# EasyEDA Pro project elisaday-high-color-value-low-cost-reflow-24a201e4.epro, schematic 电源板-无0402
Board Name: 220V电源板-无0402; Create Date: 2025-08-20; Page Name: 电源板; Project Name: 红龙加热台（星火计划2025）; Schematic Name: 电源板-无0402; Update Date: 2025-09-29; Company: 嘉立创EDA; Page Size: A4; Version: V1.0
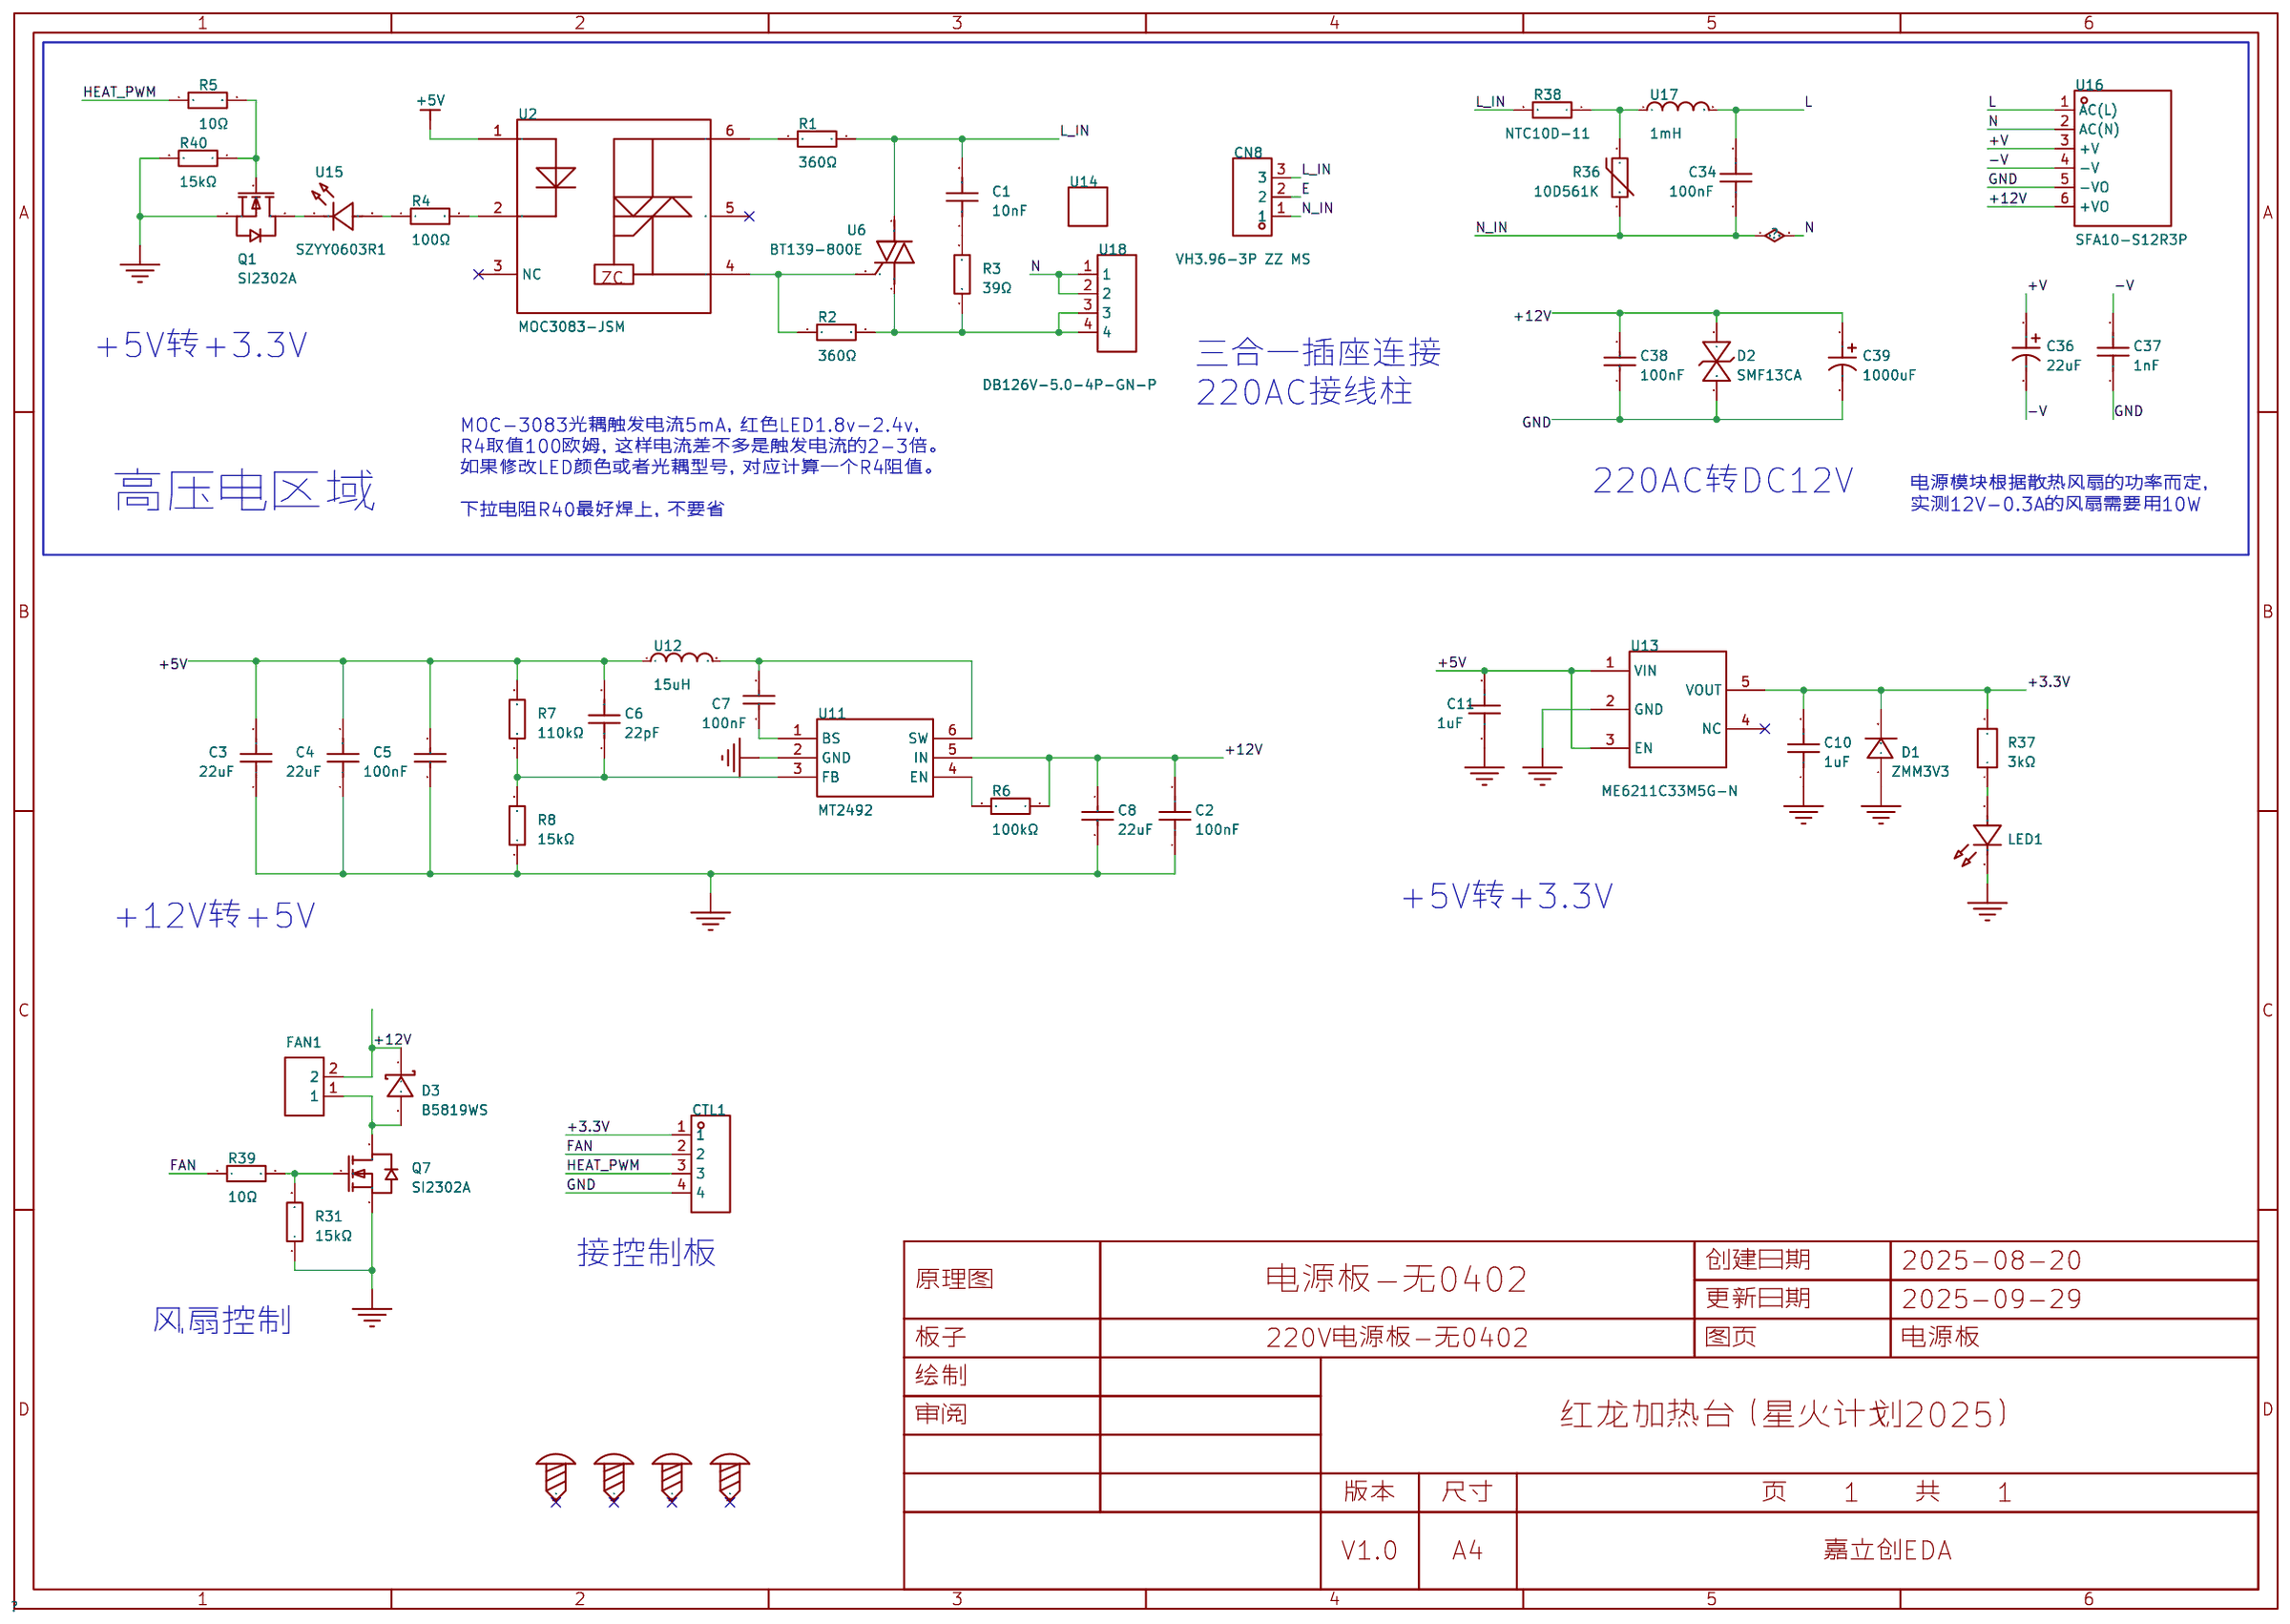
[diagram p2: schematic sheet]

## Parts
C1  10nF  [CAP-TH_L13.0-W6.0-P10.00-D1.2]
C2  100nF  [C0805]
C3  22uF  [C0603]
C4  22uF  [C0603]
C5  100nF  [C0805]
C6  22pF  [C0603]
C7  100nF  [C0805]
C8  22uF  [C1206]
C10  1uF  [C0603]
C11  1uF  [C0603]
C34  100nF  [CAP-TH_L13.0-W6.0-P10.00-D1.0]
C36  22uF  [CAP-TH_BD13.0-P5.00-D0.6-FD]
C37  1nF  [CAP-TH_L7.5-W4.5-P10.00-D0.6]
C38  100nF  [C0805]
C39  1000uF  [CAP-TH_BD10.0-P5.00-D0.6-FD]
CN8  VH3.96-3P ZZ MS  [CONN-TH_3P-P3.96_MEGASTAR_ZX-VH3.96-3PZZ]
CTL1  ZX-XH2.54-4PZZ  [CONN-TH_4P-P2.50_4PIN]
D1  ZMM3V3  [LL-34_L3.5-W1.5-LS3.5-FD]
D2  SMF13CA  [SOD-123FL_L2.8-W1.8-LS3.7-BI]
D3  B5819WS  [SOD-323_L1.8-W1.3-LS2.5-RD]
FAN1  ZX-XH2.54-2PZZ  [CONN-TH_2P-P2.50_HX25003-2A]
LED1  SZYY0603R1  [LED0603-RD]
Q1  SI2302A  [SOT-23-3_L2.9-W1.3-P1.90-LS2.4-BR]
Q7  SI2302A  [SOT-23-3_L2.9-W1.3-P1.90-LS2.4-BR]
R1  360Ω  [R2512]
R2  360Ω  [R2512]
R3  39Ω  [RES-TH_BD4.5-L11.5-P15.50-D0.7]
R4  100Ω  [R0805]
R5  10Ω  [R0805_NEW]
R6  100kΩ  [R0805]
R7  110kΩ  [R0603]
R8  15kΩ  [R0603]
R31  15kΩ  [R0603]
R36  10D561K  [RES-TH_L12.5-W7.0-P7.50-D1.2-S7.00]
R37  3kΩ  [R0603]
R38  NTC10D-11  [RES-TH_L12.5-W5.5-P7.50-D0.8-S5.50]
R39  10Ω  [R0805_NEW]
R40  15kΩ  [R0603]
SCREW1  -  [M3螺丝]
SCREW2  -  [M3螺丝]
SCREW3  -  [M3螺丝]
SCREW4  -  [M3螺丝]
U2  MOC3083-JSM  [SMD-6_L7.3-W6.5-P2.54-LS10.2-BL]
U6  BT139-800E  [TO-220-3_L10.2-W4.5-P2.54-L-1]
U11  MT2492  [SOT-23-6_L2.9-W1.6-P0.95-LS2.8-BL_3]
U12  15uH  [IND-SMD_L7.0-W6.6_FXL0630]
U13  ME6211C33M5G-N  [SOT-23-5_L3.0-W1.7-P0.95-LS2.8-BL]
U14  XSD2156-067  [HEATSINK-TH_L23.5-W16.0_XSD2156-067]
U15  SZYY0603R1  [LED0603-RD]
U16  SFA10-S12R3P  [PWRM-TH_SFA10-S12R3P]
U17  1mH  [IND-TH_BD5.0-L12.0-P16.00-D0.6]
U18  DB126V-5.0-4P-GN-P  [CONN-TH_4P-P5.00_DIBO_DB126V-5.0-4P-GN-P]

## Library data of the parts
C1 = MPP103J2J1304075LC: 容值:10nF;精度:±5%;额定电压:630V;工作温度:-40℃~+85℃;; LCSC Part Name: 10nF ±5% 630V; Supplier Part: C93289; Manufacturer: SRD(圣融达); Supplier Footprint: 插件; JLCPCB Part Class: Extended Part; Datasheet: https://atta.szlcsc.com/upload/public/pdf/source/20211112/7B10DD27AB297D99D7FD84A5C3A65F7C.pdf; Supplier: LCSC; Tolerance: ±5%; Voltage Rated: 630V; Operating Temperature: -40℃~+85℃
C2 = 0805B104K500NT: 容值:100nF;精度:±10%;额定电压:50V;温度系数:X7R;; LCSC Part Name: 100nF ±10% 50V; Supplier Part: C38141; Manufacturer: FH(风华); Supplier Footprint: 0805; JLCPCB Part Class: Extended Part; Datasheet: https://atta.szlcsc.com/upload/public/pdf/source/20200305/C486355_26A10D38EF8C2A5C37091D0039909270.pdf; Supplier: LCSC; Tolerance: ±10%; Voltage Rating: 50V; Temperature Coefficient: X7R
C3 C4 = CGA0603X5R226M100JT: 容值:22uF;精度:±20%;额定电压:10V;温度系数:X5R;; LCSC Part Name: 22uF ±20% 10V; Supplier Part: C6119863; Manufacturer: HRE(芯声); Supplier Footprint: 0603; JLCPCB Part Class: Extended Part; Supplier: LCSC; Tolerance: ±20%; Voltage Rating: 10V; Temperature Coefficient: X5R
C5 C7 C38 = 0805B104K500NT: 容值:100nF;精度:±10%;额定电压:50V;温度系数:X7R;; LCSC Part Name: 100nF ±10% 50V; Supplier Part: C38141; Manufacturer: FH(风华); Supplier Footprint: 0805; JLCPCB Part Class: 扩展库; Datasheet: https://atta.szlcsc.com/upload/public/pdf/source/20200305/C486355_26A10D38EF8C2A5C37091D0039909270.pdf; Supplier: LCSC; Tolerance: ±10%; Voltage Rating: 50V; Temperature Coefficient: X7R
C6 = CSA0603C0G220J500JT: 容值:22pF;精度:±5%;额定电压:50V;温度系数:C0G;; LCSC Part Name: 22pF ±5% 50V; Supplier Part: C18220911; Manufacturer: HRE(芯声); Supplier Footprint: 0603; JLCPCB Part Class: Extended Part; Datasheet: https://atta.szlcsc.com/upload/public/pdf/source/20220805/DFFB7DC11B0ABF32BF494A73A541956B.pdf; Supplier: LCSC; Tolerance: ±5%; Voltage Rating: 50V; Temperature Coefficient: C0G
C8 = 1206X226M250NT: 容值:22uF;精度:±20%;额定电压:25V;温度系数:X5R;; LCSC Part Name: 22uF ±20% 25V; Supplier Part: C2858005; Manufacturer: FH(风华); Supplier Footprint: 1206; JLCPCB Part Class: Extended Part; Datasheet: https://atta.szlcsc.com/upload/public/pdf/source/20241106/0372DBB53BE7B2875A5094F78173A7D7.pdf; Supplier: LCSC; Tolerance: ±20%; Voltage Rating: 25V; Temperature Coefficient: X5R
C10 C11 = CL10B105KO8NNNC: 容值:1uF;精度:±10%;额定电压:16V;材质(温度系数):X7R;; LCSC Part Name: 1uF ±10% 16V; Supplier Part: C59782; Manufacturer: SAMSUNG(三星); Supplier Footprint: 0603; JLCPCB Part Class: Extended Part; Datasheet: https://atta.szlcsc.com/upload/public/pdf/source/20160218/1457707763339.pdf; Supplier: LCSC; Tolerance: ±10%; Voltage Rated: 16V; Temperature Coefficient: X7R
C34 = MP2104K27C3X6LC: 容值:100nF;精度:±10%;工作电压(AC):275V;防护等级:X2;; LCSC Part Name: 100nF ±10% 275V 等级:X2; Supplier Part: C105759; Manufacturer: SRD(圣融达); Supplier Footprint: 插件,P=10mm; JLCPCB Part Class: 扩展库; Datasheet: https://atta.szlcsc.com/upload/public/pdf/source/20211112/28AD7BCA5F9A6D19E46F5213448E69C0.pdf; Supplier: LCSC; Tolerance: ±10%; Voltage(AC): 275V; Ratings: X2; safety certification: UL；ENEC；VDE；CQC；CSA
C36 = 450V22uF CD110: 容值:22uF;精度:±20%;额定电压:450V;; LCSC Part Name: 22uF ±20% 450V; Supplier Part: C2960304; Manufacturer: HRK(鸿瑞凯电子); Supplier Footprint: 插件,D13xL21mm; JLCPCB Part Class: 扩展库; Datasheet: https://atta.szlcsc.com/upload/public/pdf/source/20220224/99A6CB8BC3A5BEFD19A44363E27A3628.pdf; Supplier: LCSC; Tolerance: ±20%; Rated Voltage: 450V; Lead Spacing: 5mm; φD: 13mm; L: 21mm; Operating Temperature: -40℃~+105℃
C37 = KY1102M400VAC70Y10093: 容值:1nF;精度:±20%;工作电压(AC):400V;防护等级:Y1;; LCSC Part Name: 1nF ±20% 400V 等级:Y1; Supplier Part: C2943996; Manufacturer: KNSCHA(科尼盛); Supplier Footprint: 插件,P=10mm; JLCPCB Part Class: 扩展库; Datasheet: https://atta.szlcsc.com/upload/public/pdf/source/20240902/B2C4860AD6BBA55A7E27F7C368C73C02.pdf; Supplier: LCSC; Tolerance: ±20%; Voltage(AC): 400V; Ratings: Y1; safety certification: UL；ENEC；VDE；CQC
C39 = CD2881081EM1017VFL: 容值:1000uF;额定电压:25V;; LCSC Part Name: 1000uF 25V; Supplier Part: C7493865; Manufacturer: HRK(鸿瑞凯电子); Supplier Footprint: 插件,D10xL17mm; JLCPCB Part Class: 扩展库; Supplier: LCSC; Voltage Rating: 25V
CN8 = VH3.96-3P ZZ MS: 插针结构:1x3P;间距:3.96mm;安装方式:直插;参考系列:VH;总PIN数:3P;排数:1;每排PIN数:3;行距:-;额定电流:7A;触头材质:黄铜;触头镀层:锡;工作温度范围:-25℃~+85℃;; LCSC Part Name: 米色 1x3P 间距:3.96mm 直插 系列:VH; Supplier Part: C18185597; Manufacturer: SHOU HAN(首韩); Supplier Footprint: 插件,P=3.96mm; JLCPCB Part Class: 扩展库; Supplier: LCSC; Pins Structure: 1x3P; Pitch: 3.96mm; Mounting Type: 直插; Reference Series: VH; Number of Pins: 3P; Number of Rows: 1; Number of PINs Per Row: 3; Current Rating: 7A; Contact Material: 黄铜; Contact Plating: 锡; Operating Temperature: -25℃~+85℃; Voltage Rating: 250V; Plastic Material: PA6T; Flame Retardant Rating: UL94V-0; Color: 米色
CTL1 = ZX-XH2.54-4PZZ: 插针结构:1x4P;间距:2.5mm;安装方式:直插;参考系列:XH;总PIN数:4P;排数:1;每排PIN数:4;行距:-;额定电流:3A;触头材质:黄铜;触头镀层:锡;工作温度范围:-25℃~+85℃;; LCSC Part Name: 1x4P 间距:2.5mm 直插 系列:XH; Supplier Part: C7429634; Manufacturer: Megastar(兆星); Supplier Footprint: 插件,P=2.5mm; JLCPCB Part Class: 扩展库; Datasheet: https://atta.szlcsc.com/upload/public/pdf/source/20230619/B529A2163E0159A644AB3383D208FB03.pdf; Supplier: LCSC; Pins Structure: 1x4P; Pitch: 2.5mm; Mounting Type: 直插; Reference Series: XH; Number of Pins: 4P; Number of Rows: 1; Number of PINs Per Row: 4; Rated Current: 3A; Contact Material: 黄铜; Contact Plating: 锡; Operating Temperature: -25℃~+85℃; Rated Voltage (Max): 250V; Plastic Material: PA66; Flame Retardant Rating: UL94V-0; Color: 白色; Z-Height of the Board: 7mm; X-Length of Bottom Edge on Board (Spacing Line): 12.5mm; Y-Width of Bottom Edge on Board: 5.9mm
D1 = ZMM3V3: 二极管配置:-;稳压值(标称值):3.3V;稳压值(范围):3.1V~3.5V;功率(Pd):500mW;; Supplier Part: C2857242; Manufacturer: JSMSEMI(杰盛微); Supplier Footprint: LL-34; JLCPCB Part Class: 扩展库; Datasheet: https://atta.szlcsc.com/upload/public/pdf/source/20240105/AB2CCC1AF8AC07DFF2A37C65A0EBD01D.pdf; Supplier: LCSC; Zener Voltage (Nom): 3.3V; Reverse Leakage Current (Ir): 2uA@1V; Zener Voltage (Range): 3.1V~3.5V; Power Dissipation: 500mW; Zener Impedance (Zzt): 90Ω
D2 = SMF13CA_C2857326: 反向截止电压(Vrwm):13V;最大钳位电压:21.5V;峰值脉冲电流(Ipp):9.3A;击穿电压:14.4V;; Supplier Part: C2857326; Manufacturer: JSMSEMI(杰盛微); Supplier Footprint: SOD-123FL; JLCPCB Part Class: 扩展库; Datasheet: https://atta.szlcsc.com/upload/public/pdf/source/20220120/4066B4D37095FB947F97BAEB950D8525.pdf; Supplier: LCSC; Reverse Stand-Off Voltage (Vrwm): 13V; Maximum Clamping Voltage: 21.5V; Peak Pulse Current (Ipp): 9.3A; Breakdown Voltage: 14.4V; Reverse Leakage Current (Ir): 1uA; Type: TVS
D3 = B5819WS_C22624: 正向压降(Vf):600mV@1A;直流反向耐压(Vr):40V;平均整流电流(Io):1A;; LCSC Part Name: 电压:40V 电流:1A; Supplier Part: C22624; Manufacturer: CJ(江苏长电/长晶); Supplier Footprint: SOD-323; JLCPCB Part Class: 扩展库; Datasheet: https://atta.szlcsc.com/upload/public/pdf/source/20150407/1457707273359.pdf; Supplier: LCSC; Forward Voltage (Vf@If): 600mV@1A; Reverse Voltage (Vr): 40V; Average Rectified Current (Io): 1A
FAN1 = ZX-XH2.54-2PZZ: 插针结构:1x2P;间距:2.5mm;安装方式:直插;参考系列:XH;总PIN数:2P;排数:1;每排PIN数:2;行距:-;额定电流:3A;触头材质:黄铜;触头镀层:锡;工作温度范围:-25℃~+85℃;; LCSC Part Name: 1x2P 间距:2.5mm 直插 系列:XH; Supplier Part: C7429632; Manufacturer: Megastar(兆星); Supplier Footprint: 插件,P=2.5mm; JLCPCB Part Class: 扩展库; Datasheet: https://atta.szlcsc.com/upload/public/pdf/source/20230619/19BA6947230AA44A04D3EDD65E618FD0.pdf; Supplier: LCSC; Pins Structure: 1x2P; Pitch: 2.5mm; Mounting Type: 直插; Reference Series: XH; Number of Pins: 2P; Number of Rows: 1; Number of PINs Per Row: 2; Rated Current: 3A; Contact Material: 黄铜; Contact Plating: 锡; Operating Temperature: -25℃~+85℃; Rated Voltage (Max): 250V; Plastic Material: PA66; Flame Retardant Rating: UL94V-0; Color: 白色; Z-Height of the Board: 7mm; X-Length of Bottom Edge on Board (Spacing Line): 7.5mm; Y-Width of Bottom Edge on Board: 5.9mm
LED1 U15 = SZYY0603R1: Supplier Part: C19712529; Manufacturer: yongyu(永裕光电); Supplier Footprint: 0603; JLCPCB Part Class: Extended Part; Datasheet: https://atta.szlcsc.com/upload/public/pdf/source/20231222/68E0E04212BE1F16675F0D4DD2603BDF.pdf; Supplier: LCSC
Q1 Q7 = SI2302A: 类型:1个N沟道;漏源电压(Vdss):20V;连续漏极电流(Id):3.6A;导通电阻(RDS(on)@Vgs,Id):60mΩ@2.5V,3.1A;功率(Pd):800mW;阈值电压(Vgs(th)@Id):1.9V@250uA;; LCSC Part Name: 1个N沟道 耐压:20V 电流:3.6A; Supplier Part: C347483; Manufacturer: UMW(友台半导体); Supplier Footprint: SOT-23; JLCPCB Part Class: 扩展库; Datasheet: https://atta.szlcsc.com/upload/public/pdf/source/20231109/A05513FBA15B68C9BEB83ADF1A9CDC8E.pdf; Supplier: LCSC; Type: 1个N沟道; Drain Source Voltage (Vdss): 20V; Continuous Drain Current (Id): 3.6A; Drain Source On Resistance (RDS(on)@Vgs,Id): 60mΩ@2.5V,3.1A; Power Dissipation (Pd): 800mW; Gate Threshold Voltage (Vgs(th)@Id): 1.9V@250uA; Total Gate Charge (Qg@Vgs): 10nC@4.5V; Input Capacitance (Ciss@Vds): 300pF@10V; Reverse Transfer Capacitance (Crss@Vds): 80pF@10V; Operating Temperature: -55℃~+150℃
R1 R2 = 25121WF3600T4E: 电阻类型:厚膜电阻;阻值:360Ω;精度:±1%;功率:1W;最大工作电压:200V;温度系数:±100ppm/℃;; LCSC Part Name: 360Ω ±1% 1W 厚膜电阻; Supplier Part: C620881; Manufacturer: UNI-ROYAL(厚声); Supplier Footprint: 2512; JLCPCB Part Class: 扩展库; Datasheet: https://atta.szlcsc.com/upload/public/pdf/source/20200306/C422600_1E6D84923E4A46A82E41ADD87F860B5C.pdf; Supplier: LCSC; Type: 厚膜电阻; Tolerance: ±1%; Power(Watts): 1W; Overload Voltage (Max): 200V; Temperature Coefficient: ±100ppm/℃; Operating Temperature Range: -55℃~+155℃
R3 = MFR01SF390JA10: 电阻类型:金属膜电阻;阻值:39Ω;精度:±1%;功率:1W;温度系数:±50ppm/℃;; LCSC Part Name: 39Ω ±1% 1W 金属膜电阻 小体积,铜脚，圆柱状直插; Supplier Part: C58700; Manufacturer: UNI-ROYAL(厚声); Supplier Footprint: 插件,D3.5xL9.5mm; JLCPCB Part Class: Extended Part; Datasheet: https://atta.szlcsc.com/upload/public/pdf/source/20191012/C436293_8820AA14BC71FA35E551C06C441482A0.pdf; Supplier: LCSC; Type: 金属膜电阻; Tolerance: ±1%; Voltage-Supply(Max): 350V; Power(Watts): 1W; Temperature Coefficient: ±50ppm/℃
R4 = 0805W8F1000T5E: 电阻类型:厚膜电阻;阻值:100Ω;精度:±1%;功率:125mW;最大工作电压:150V;温度系数:±100ppm/℃;; LCSC Part Name: 100Ω ±1% 125mW 厚膜电阻; Supplier Part: C17408; Manufacturer: UNI-ROYAL(厚声); Supplier Footprint: 0805; JLCPCB Part Class: 基础库; Datasheet: https://atta.szlcsc.com/upload/public/pdf/source/20200306/C422600_1E6D84923E4A46A82E41ADD87F860B5C.pdf; Supplier: LCSC; Type: 厚膜电阻; Tolerance: ±1%; Power(Watts): 125mW; Overload Voltage (Max): 150V; Temperature Coefficient: ±100ppm/℃; Operating Temperature Range: -55℃~+155℃
R5 R39 = 0805W8F100JT5E: 电阻类型:厚膜电阻;阻值:10Ω;精度:±1%;功率:125mW;最大工作电压:150V;温度系数:±200ppm/℃;; LCSC Part Name: 10Ω ±1% 125mW 厚膜电阻; Supplier Part: C17415; Manufacturer: UNI-ROYAL(厚声); Supplier Footprint: 0805; JLCPCB Part Class: Basic Part; Datasheet: https://atta.szlcsc.com/upload/public/pdf/source/20200306/C422600_1E6D84923E4A46A82E41ADD87F860B5C.pdf; Supplier: LCSC; Type: 厚膜电阻; Tolerance: ±1%; Power(Watts): 125mW; Overload Voltage (Max): 150V; Temperature Coefficient: ±200ppm/℃; Operating Temperature Range: -55℃~+155℃
R6 = 0805W8F1003T5E: 电阻类型:厚膜电阻;阻值:100kΩ;精度:±1%;功率:125mW;最大工作电压:150V;温度系数:±100ppm/℃;; LCSC Part Name: 100kΩ ±1% 125mW 厚膜电阻; Supplier Part: C149504; Manufacturer: UNI-ROYAL(厚声); Supplier Footprint: 0805; JLCPCB Part Class: 基础库; Datasheet: https://atta.szlcsc.com/upload/public/pdf/source/20200306/C422600_1E6D84923E4A46A82E41ADD87F860B5C.pdf; Supplier: LCSC; Type: 厚膜电阻; Tolerance: ±1%; Power(Watts): 125mW; Overload Voltage (Max): 150V; Temperature Coefficient: ±100ppm/℃; Operating Temperature Range: -55℃~+155℃
R7 = 0603WAF1103T5E: 电阻类型:厚膜电阻;阻值:110kΩ;精度:±1%;功率:100mW;工作电压:75V;温度系数:±100ppm/℃;; LCSC Part Name: 110kΩ ±1% 100mW 厚膜电阻; Supplier Part: C25805; Manufacturer: UNI-ROYAL(厚声); Supplier Footprint: 0603; JLCPCB Part Class: Extended Part; Datasheet: https://atta.szlcsc.com/upload/public/pdf/source/20200306/C422600_1E6D84923E4A46A82E41ADD87F860B5C.pdf; Supplier: LCSC; Type: 厚膜电阻; Tolerance: ±1%; Power(Watts): 100mW; Voltage-Supply(Max): 75V; Temperature Coefficient: ±100ppm/℃; Operating Temperature: -55℃~+155℃
R8 R31 R40 = 0603WAF1502T5E: 电阻类型:厚膜电阻;阻值:15kΩ;精度:±1%;功率:100mW;最大工作电压:75V;温度系数:±100ppm/℃;; LCSC Part Name: 15kΩ ±1% 100mW 厚膜电阻; Supplier Part: C22809; Manufacturer: UNI-ROYAL(厚声); Supplier Footprint: 0603; JLCPCB Part Class: Basic Part; Datasheet: https://atta.szlcsc.com/upload/public/pdf/source/20200306/C422600_1E6D84923E4A46A82E41ADD87F860B5C.pdf; Supplier: LCSC; Type: 厚膜电阻; Tolerance: ±1%; Power(Watts): 100mW; Overload Voltage (Max): 75V; Temperature Coefficient: ±100ppm/℃; Operating Temperature Range: -55℃~+155℃
R36 = 10D561K_C233178: 压敏电压:504V~616V;钳位电压:920V;最大工作电压(DC):460V;最大工作电压(AC):350V;; LCSC Part Name: 钳位电压920V 42.3焦耳 插件压敏电阻; Supplier Part: C233178; Manufacturer: RUILON(瑞隆源); Supplier Footprint: 插件; JLCPCB Part Class: 扩展库; Datasheet: https://atta.szlcsc.com/upload/public/pdf/source/20180619/C233186_9A7AF57C0A178A4DEED9AC3F9621CA64.pdf; Supplier: LCSC; Varistor Voltage: 504V~616V; Clamping Voltage: 920V; Allowable Voltage (DC): 460V; Allowable Voltage (AC): 350V; Peak Current: 2.5kA; Maximum Energy: 42.3J; Typical Capatitance: 180pF@1kHz
R37 = 0603WAF3001T5E: 电阻类型:厚膜电阻;阻值:3kΩ;精度:±1%;功率:100mW;工作电压:75V;温度系数:±100ppm/℃;; LCSC Part Name: 3kΩ ±1% 100mW 厚膜电阻; Supplier Part: C4211; Manufacturer: UNI-ROYAL(厚声); Supplier Footprint: 0603; JLCPCB Part Class: Basic Part; Datasheet: https://atta.szlcsc.com/upload/public/pdf/source/20200306/C422600_1E6D84923E4A46A82E41ADD87F860B5C.pdf; Supplier: LCSC; Type: 厚膜电阻; Tolerance: ±1%; Power(Watts): 100mW; Voltage-Supply(Max): 75V; Temperature Coefficient: ±100ppm/℃; Operating Temperature: -55℃~+155℃
R38 = NTC10D-11: 阻值(25℃):10Ω;B值(25℃/50℃):-;电阻精度:-;功率:-;B值精度:-;最大稳态电流(25℃):3A;; LCSC Part Name: 10Ω; Supplier Part: C53820; Manufacturer: RUILON(瑞隆源); Supplier Footprint: 插件,P=7.5mm; JLCPCB Part Class: Extended Part; Datasheet: https://atta.szlcsc.com/upload/public/pdf/source/20180410/C207392_007A1CB20DB6E487C695D7783FF0F5F9.pdf; Supplier: LCSC; Resistance @ 25℃: 10Ω; Steady State Current (Max): 3A; Operating Temperature: -55℃~+200℃
SCREW1-SCREW4 = M3螺丝: Supplier Footprint: 插件; Check: false
U2 = MOC3083-JSM: 可控硅类型:双向可控硅;正向压降(Vf):1.2V;输出电流(It(rms)):-;正向电流:50mA;负载电压:800V;静态dv/dt:1500V/us;; Supplier Part: C18221466; Manufacturer: JSMSEMI(杰盛微); Supplier Footprint: SOP-6; JLCPCB Part Class: 扩展库; Datasheet: https://atta.szlcsc.com/upload/public/pdf/source/20231012/A286E1A134574E687FDA50F333E3B813.pdf; Supplier: LCSC; SCR Type: 双向可控硅; Zero Crossing Circuit: 有; Forward Voltage: 1.2V; Isolation Voltage(rms): 5kV; Forward Current: 50mA; Load Voltage: 800V; Static dv/dt: 1500V/us; Number of Outputs: 1; Operating Temperature: -40℃~+100℃
U6 = BT139-800E_C916616: 可控硅类型:1个双向可控硅;保持电流(Ih):45mA;断态峰值电压(Vdrm):800V;门极触发电流(Igt):10mA;; Supplier Part: C916616; Manufacturer: JSMSEMI(杰盛微); Supplier Footprint: TO-220; JLCPCB Part Class: 扩展库; Datasheet: https://atta.szlcsc.com/upload/public/pdf/source/20230807/6277CE63C56AFD259EEAE46D1FB8470B.pdf; Supplier: LCSC; Output Type: 1个双向可控硅; Gate Trigger   Voltage (Vgt): 1.5V; Holding Current (Ih): 45mA; Peak off - state voltage(Vdrm): 800V; Current - Gate Trigger(Igt): 10mA; Voltage - On State(Vtm): 1.6V; Current - Surge(Itsm@f): 155A@20ms; Average Gate Power Dissipation (PG(AV)): 500mW; Current - On State(It(RMS)): 16A
U11 = MT2492: 功能类型:降压型;输出类型:-;工作电压:4.5V~16V;输出电压:-;输出电流:2A;; LCSC Part Name: 2A高效同步降压转换器; Supplier Part: C89358; Manufacturer: 西安航天民芯; Supplier Footprint: SOT-23-6; JLCPCB Part Class: 扩展库; Datasheet: https://atta.szlcsc.com/upload/public/pdf/source/20221209/5C81DA9662873D3A116170FFBF63E49D.pdf; Supplier: LCSC; Function: 降压型; Voltage - Supply: 4.5V~16V; Output Current: 2A; Frequency - Switching: 600kHz; Operating Temperature: -40℃~+85℃; Synchronous Rectifier: 是; Number of Outputs: 1; Topology: 降压式; Switch tube (built-in/external): 内置
U12 = CXP0630-150M-AG(15uh): 电感值:15uH;精度:±20%;额定电流:3.5A;饱和电流(Isat):4.5A;类型:一体成型电感;; LCSC Part Name: 15uH ±20% 4.5A; Supplier Part: C7461362; Manufacturer: DMBJ(振宝佳); Supplier Footprint: 0630; JLCPCB Part Class: 扩展库; Datasheet: https://atta.szlcsc.com/upload/public/pdf/source/20230706/7F3A5B39C5AD80A91C9FA782B54A296B.pdf; Supplier: LCSC; Tolerance: ±20%; Rated Current: 3.5A; Saturation Current (Isat): 4.5A; DC Resistance (DCR): 115mΩ; Type: 一体成型电感
U13 = ME6211C33M5G-N: 输出类型:固定;工作电压:6V;输出电压:3.3V;输出电流:500mA;电源纹波抑制比(PSRR):70dB@(1kHz)；62dB@(10kHz);输出极性:正极;; LCSC Part Name: 输入6V 输出3.3V 500mA; Supplier Part: C82942; Manufacturer: MICRONE(南京微盟); Supplier Footprint: SOT-23-5; JLCPCB Part Class: Extended Part; Datasheet: https://atta.szlcsc.com/upload/public/pdf/source/20170918/C82942_1505727073070976520.pdf; Supplier: LCSC; Output Type: 固定; Voltage - Supply: 6V; Output Voltage: 3.3V; Output Current: 500mA; Power Supply Rejection Ratio (PSRR): 70dB@(1kHz)；62dB@(10kHz); Voltage Dropout: 260mV@(200mA); Features: 短路保护(SCP)；低ESR；过流保护(OCP)；带使能; Output Configuration: 正极; Number of Outputs: 1
U14 = XSD2156-067: 产品尺寸:23.5*16*25MM;材 质:-;; LCSC Part Name: XSD(鑫顺达)，23.5*16*25MM本色无针，XSD2156-067; Supplier Part: C7421514; Manufacturer: XSD(鑫顺达); Supplier Footprint: 23.5x16x25; JLCPCB Part Class: Extended Part; Datasheet: https://atta.szlcsc.com/upload/public/pdf/source/20240104/E923EAEEB98622507CCC9553602D08DA.pdf; Supplier: LCSC; ProductSize: 23.5*16*25MM; Colour: 本色
U16 = SFA10-S12R3P: 输入电压(DC):100V~400V;输出电压:12V;输出功率:10W;输入电压(AC):85VAC~305VAC;输出电流(最大值):830mA;转换效率:81%;; LCSC Part Name: 10W AC-DC裸板电源模块; Supplier Part: C5259123; Manufacturer: ZOEYGO(中逸光); JLCPCB Part Class: 扩展库; Datasheet: https://atta.szlcsc.com/upload/public/pdf/source/20221111/16C539EAF15862D588C0604624DF4362.pdf; Supplier: LCSC; Input Voltage(DC): 100V~400V; Output Voltage: 12V; Output Power: 10W; Input Voltage(AC): 85VAC~305VAC; Output Current (Max): 830mA; Conversion Efficiency: 81%
U17 = AL0512-102K-LF: 电感值:1mH;精度:±10%;额定电流:250mA;饱和电流(Isat):-;类型:色环电感;Q值:-;; LCSC Part Name: 1mH ±10% 色环电感; Supplier Part: C2943380; Manufacturer: ZE(增益); Supplier Footprint: 插件,D5xL12mm; JLCPCB Part Class: 扩展库; Datasheet: https://atta.szlcsc.com/upload/public/pdf/source/20220223/A18065814C03F0889C06706E4CF4683C.pdf; Supplier: LCSC; Tolerance: ±10%; Rated Current: 250mA; DC Resistance: 7.5Ω; Type: 色环电感
U18 = DB126V-5.0-4P-GN-P: 结构:1x4P;间距:5mm;颜色:绿色;安装方式:直插;排数:1;每排PIN数:4;额定电流:8A;额定电压:300V;线规 - AWG:14~26;线规 - 平方毫米:2.5;工作温度:-40℃~+105℃;; LCSC Part Name: 1x4P 5mm 直插 排数:1 每排P数:4; Supplier Part: C717432; Manufacturer: DORABO(地博电气); Supplier Footprint: 插件,P=5mm; JLCPCB Part Class: 扩展库; Datasheet: https://atta.szlcsc.com/upload/public/pdf/source/20230406/A033F46F5FECA00BC1B8D9A3F749A51C.pdf; Supplier: LCSC; Number of Positions or Pins: 1x4P; Pitch: 5mm; Color: 绿色; Mounting Type: 直插; Number of Pins: 4P; Number of Rows: 1; Number of PINs Per Row: 4; Screw Specification: M2.5; Current Rating: 8A; Voltage Rating (Max): 300V; Wire Gauge - AWG: 14~26; Wire Gauge - mm2: 2.5; Operating Temperature: -40℃~+105℃

## Nets
+3.3V: C10.2 CTL1.1 D1.2(C) R37.2 U13.5(VOUT)
+5V: C3.2 C4.2 C5.1 C6.2 C11.2 R7.2 U2.1 U12.1 U13.1(VIN) U13.3(EN)
+12V: C2.2 C8.1 C38.2 C39.1 D2.2(A) D3.1(K) FAN1.2 R6.1 U11.5(IN) U16.6(+VO)
GND: C2.1 C3.1 C4.1 C5.2 C8.2 C10.1 C11.1 C37.1 C38.1 C39.2 CTL1.4 D1.1(A) D2.1(C) LED1.1(K) Q1.2(S) Q7.2(S) R8.1 R31.1 R40.2 U11.2(GND) U13.2(GND) U16.5(-VO)
+V: C36.1 U16.3(+V)
-V: C36.2 C37.2 U16.4(-V)
E: CN8.2
FAN: CTL1.2 R39.1
HEAT_PWM: CTL1.3 R5.1
L: C34.1 U16.1(AC(L)) U17.2
L_IN: C1.2 CN8.3 R1.2 R38.2 U6.2(T2)
N: C34.2 CN8.1 R36.2 U16.2(AC(N)) U18.1 U18.2
$1N668: R2.1 U2.4 U6.3(G)
$1N1007: R1.1 U2.6
$1N1123: C1.1 R3.2
$1N1356: R4.2 U2.2
$1N1954: Q1.1(G) R5.2 R40.1
$1N3373: R6.2 U11.4(EN)
$1N3374: C7.2 U11.1(BS)
$1N3375: C7.1 U11.6(SW) U12.2
$1N3378: C6.1 R7.1 R8.2 U11.3(FB)
$1N10591: LED1.2(A) R37.1
$1N15927: D3.2(A) FAN1.1 Q7.3(D)
$1N15933: Q7.1(G) R31.2 R39.2
$1N17690: Q1.3(D) U15.1(K)
$1N17693: R4.1 U15.2(A)
$1N20003: R36.1 R38.1 U17.1
$1N31397: R2.2 R3.1 U6.1(T1) U18.3 U18.4

Not connected (* = marked no-connect by the designer): SCREW1 1*; SCREW2 1*; SCREW3 1*; SCREW4 1*; U2 3(NC)* 5*; U13 4(NC)*

## Notes on the sheet
- 三合一插座连接
  220AC接线柱
- +5V转+3.3V
- MOC-3083光耦触发电流5mA，红色LED1.8v-2.4v，
  R4取值100欧姆，这样电流差不多是触发电流的2-3倍。
  如果修改LED颜色或者光耦型号，对应计算一个R4阻值。
  下拉电阻R40最好焊上，不要省
- 电源模块根据散热风扇的功率而定，
  实测12V-0.3A的风扇需要用10W
- 220AC转DC12V
- 高压电区域
- +5V转+3.3V
- +12V转+5V
- 接控制板
- 风扇控制
